# Altium schematic sheet 01_Power.SchDoc: POWER DISTRIBUTION
size 406 x 279 mm; Revision: A - DRAFT; Date: 2026-11-18; SheetNumber: 1; SheetTotal: 3; Author: Sarbfateh Suppal; DocumentNumber: ROVER-A-1; ProjectName: Four-motor Rover Carrier
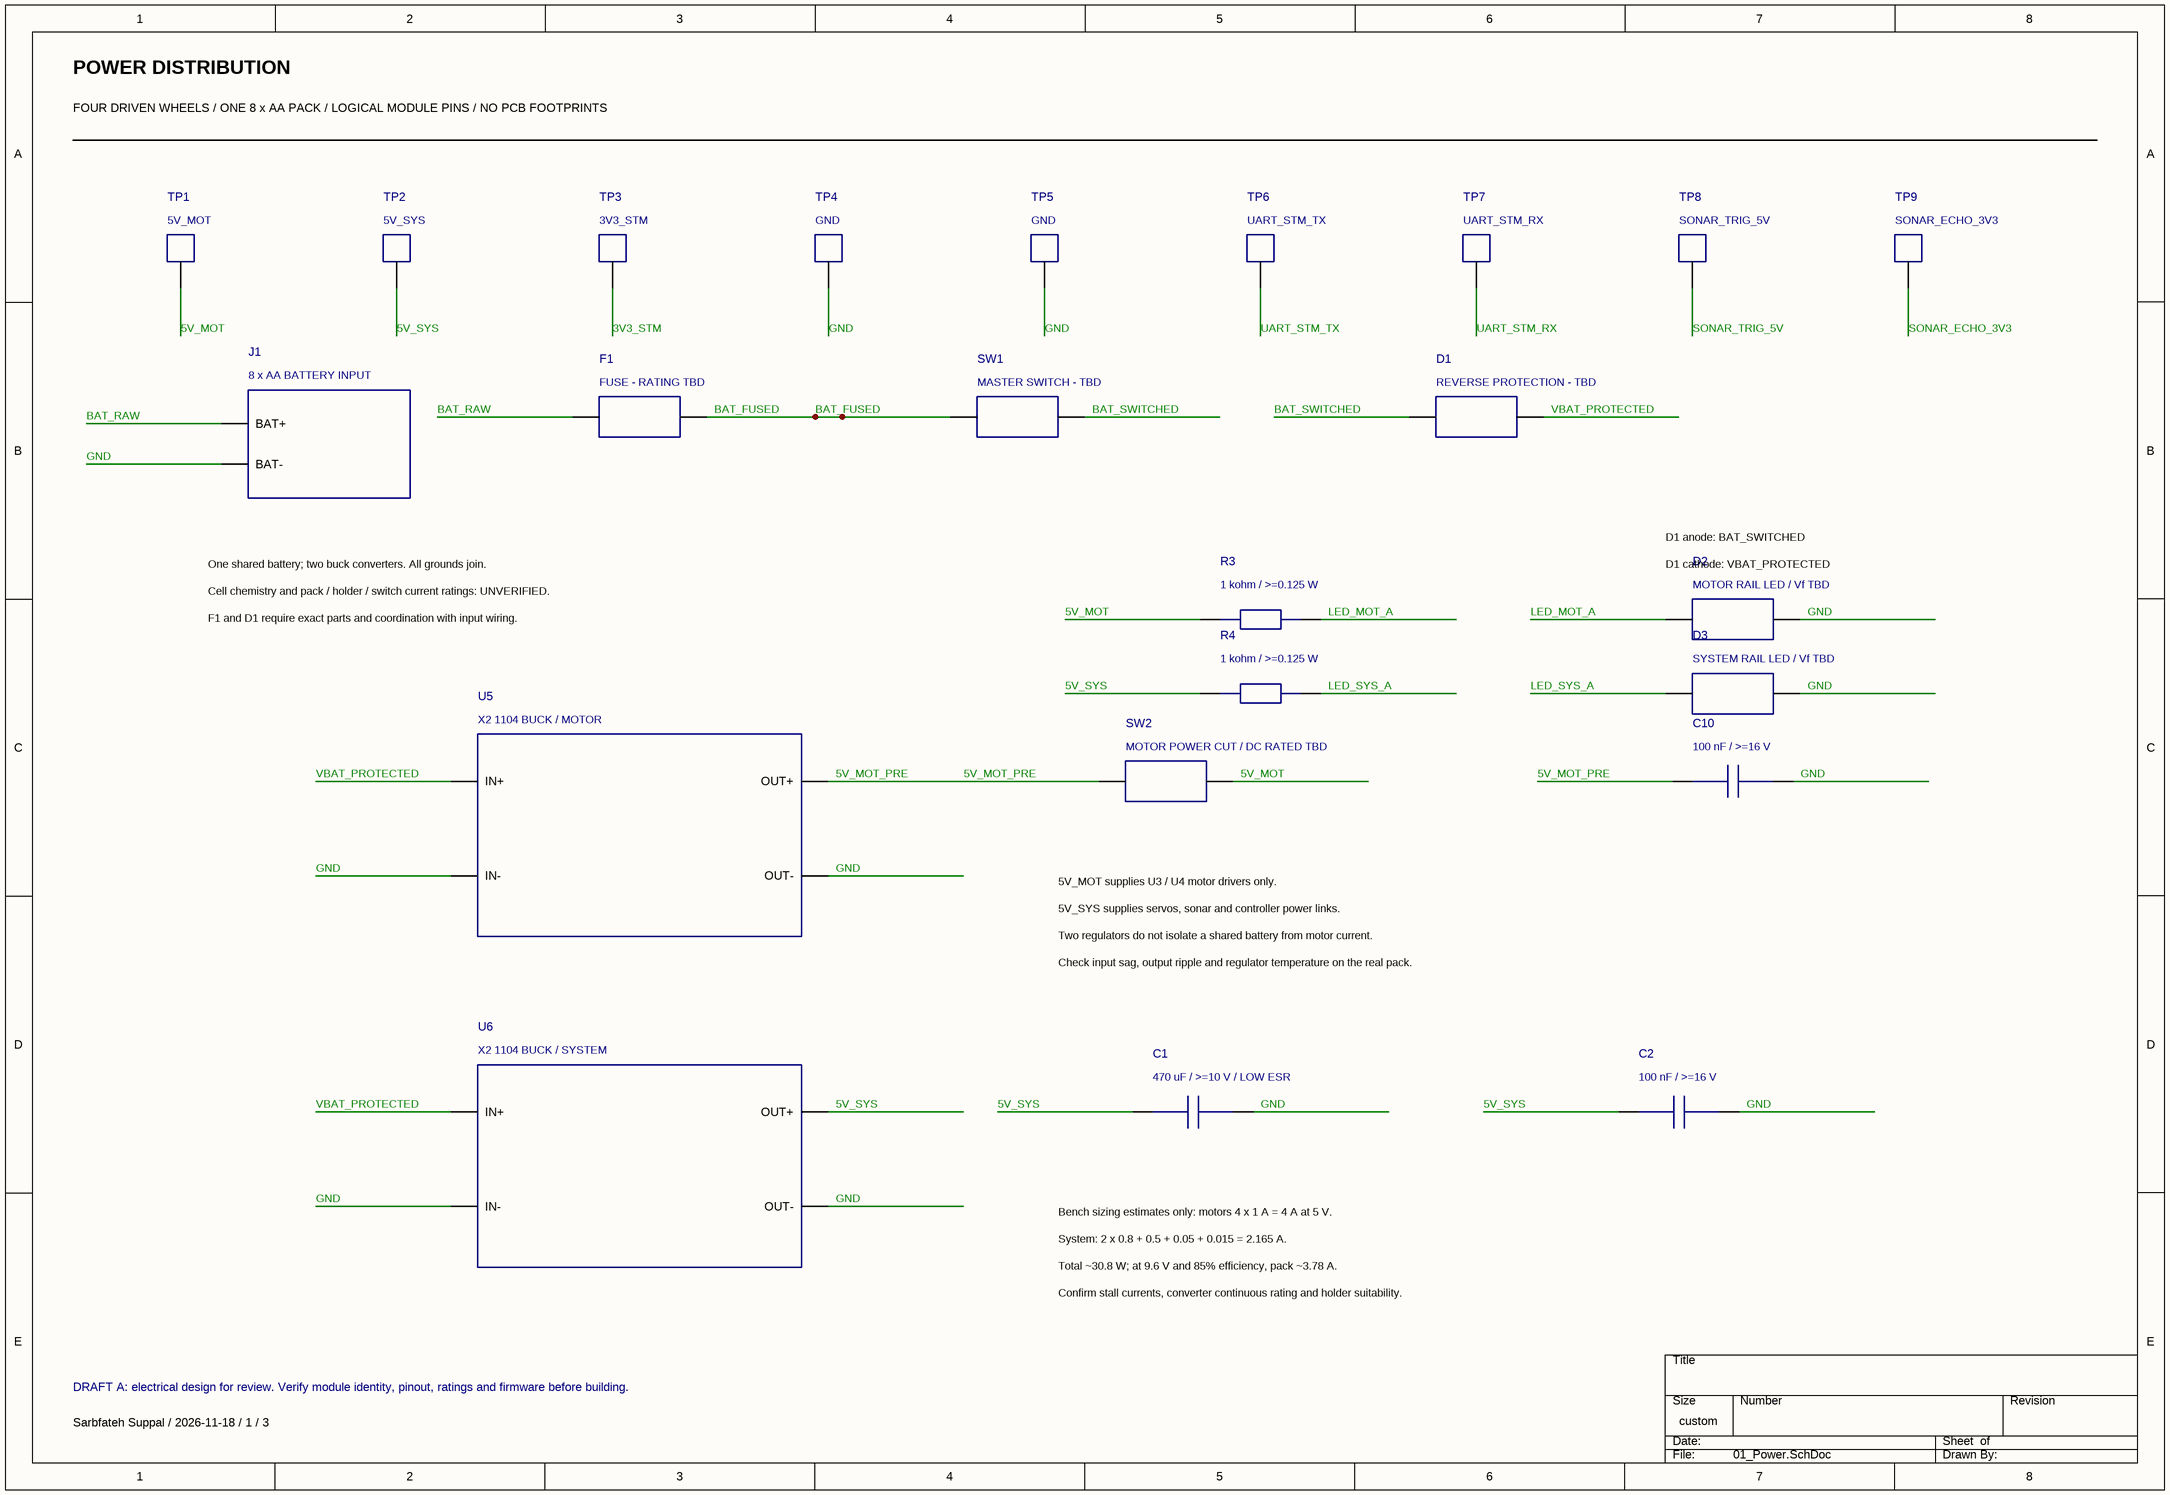
[diagram p0: 01_Power.SchDoc]

## Parts
C1  470 uF / >=10 V / LOW ESR
C2  100 nF / >=16 V
C10  100 nF / >=16 V
D1  REVERSE PROTECTION - TBD
D2  MOTOR RAIL LED / Vf TBD
D3  SYSTEM RAIL LED / Vf TBD
F1  FUSE - RATING TBD
J1  8 x AA BATTERY INPUT
R3  1 kohm / >=0.125 W
R4  1 kohm / >=0.125 W
SW1  MASTER SWITCH - TBD
SW2  MOTOR POWER CUT / DC RATED TBD
TP1  5V_MOT
TP2  5V_SYS
TP3  3V3_STM
TP4  GND
TP5  GND
TP6  UART_STM_TX
TP7  UART_STM_RX
TP8  SONAR_TRIG_5V
TP9  SONAR_ECHO_3V3
U5  X2 1104 BUCK / MOTOR
U6  X2 1104 BUCK / SYSTEM

## Nets
3V3_STM: TP3.1
5V_MOT: R3.1 SW2.2 TP1.1
5V_MOT_PRE: C10.1 SW2.1 U5.OUT+
5V_SYS: C1.1 C2.1 R4.1 TP2.1 U6.OUT+
BAT_FUSED: F1.2 SW1.1
BAT_RAW: F1.1 J1.1(BAT+)
BAT_SWITCHED: D1.1 SW1.2
GND: C1.2 C2.2 C10.2 D2.2 D3.2 J1.2(BAT-) TP4.1 TP5.1 U5.IN- U5.OUT- U6.IN- U6.OUT-
LED_MOT_A: D2.1 R3.2
LED_SYS_A: D3.1 R4.2
SONAR_ECHO_3V3: TP9.1
SONAR_TRIG_5V: TP8.1
UART_STM_RX: TP7.1
UART_STM_TX: TP6.1
VBAT_PROTECTED: D1.2 U5.IN+ U6.IN+

## Notes on the sheet
- POWER DISTRIBUTION
- FOUR DRIVEN WHEELS / ONE 8 x AA PACK / LOGICAL MODULE PINS / NO PCB FOOTPRINTS
- One shared battery; two buck converters. All grounds join.
- D1 anode: BAT_SWITCHED
- (near D2) D1 cathode: VBAT_PROTECTED
- Cell chemistry and pack / holder / switch current ratings: UNVERIFIED.
- F1 and D1 require exact parts and coordination with input wiring.
- 5V_MOT supplies U3 / U4 motor drivers only.
- 5V_SYS supplies servos, sonar and controller power links.
- Two regulators do not isolate a shared battery from motor current.
- Check input sag, output ripple and regulator temperature on the real pack.
- Bench sizing estimates only: motors 4 x 1 A = 4 A at 5 V.
- System: 2 x 0.8 + 0.5 + 0.05 + 0.015 = 2.165 A.
- Total ~30.8 W; at 9.6 V and 85% efficiency, pack ~3.78 A.
- Confirm stall currents, converter continuous rating and holder suitability.
- DRAFT A: electrical design for review. Verify module identity, pinout, ratings and firmware before building.
- Sarbfateh Suppal / 2026-11-18 / 1 / 3

## Library data of the parts
C1 = capacitor_C1
C2 = capacitor_C2
C10 = capacitor_C10
D1 = diode_D1
D2 = led_D2
D3 = led_D3
F1 = fuse_F1
J1 = module_J1
R3 = resistor_R3
R4 = resistor_R4
SW1 = switch_SW1
SW2 = switch_SW2
TP1 = testpoint_TP1
TP2 = testpoint_TP2
TP3 = testpoint_TP3
TP4 = testpoint_TP4
TP5 = testpoint_TP5
TP6 = testpoint_TP6
TP7 = testpoint_TP7
TP8 = testpoint_TP8
TP9 = testpoint_TP9
U5 = module_U5
U6 = module_U6